# Altium schematic sheet Power_48_20V@3A.SchDoc
size A3
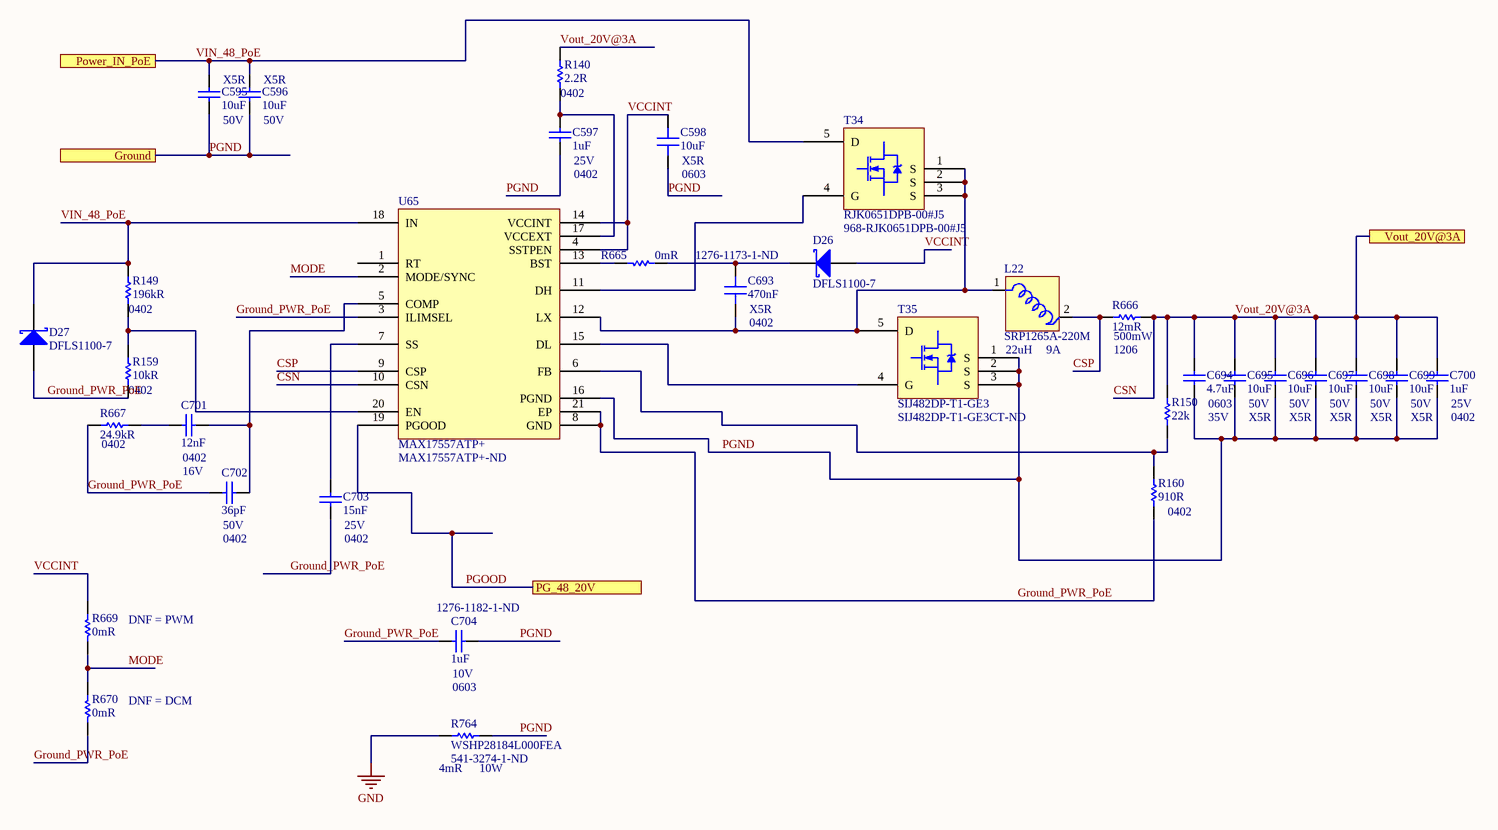
[diagram p0: Power_48_20V@3A.SchDoc]

## Parts
C595  10uF  Voltage Rating (DC): 50V  Dielectric: X5R  [CAP 0805/2012 RF]
C596  10uF  Voltage Rating (DC): 50V  Dielectric: X5R  [CAP 0805/2012 RF]
C597  1uF  Case/Package: 0402  Voltage Rating: 25V  [CAP 0402/1005 KK]
C598  10uF  Case/Package: 0603  Dielectric: X5R  [CAP 0603/1608 RF]
C693  470nF  Supplier Part Number 1: 1276-1173-1-ND  Case/Package: 0402  Dielectric: X5R  [CAP 0402/1005 KK]
C694  4.7uF  Case/Package: 0603  Voltage Rating: 35V  [CAP 0603/1608 RF]
C695  10uF  Voltage Rating (DC): 50V  Dielectric: X5R  [CAP 0805/2012 RF]
C696  10uF  Voltage Rating (DC): 50V  Dielectric: X5R  [CAP 0805/2012 RF]
C697  10uF  Voltage Rating (DC): 50V  Dielectric: X5R  [CAP 0805/2012 RF]
C698  10uF  Voltage Rating (DC): 50V  Dielectric: X5R  [CAP 0805/2012 RF]
C699  10uF  Voltage Rating (DC): 50V  Dielectric: X5R  [CAP 0805/2012 RF]
C700  1uF  Case/Package: 0402  Voltage Rating: 25V  [CAP 0402/1005 KK]
C701  12nF  Case/Package: 0402  Voltage Rating: 16V  [CAP 0402/1005 KK]
C702  36pF  Case Code (Imperial): 0402  Voltage Rating (DC): 50V  [CAP 0402/1005 KK]
C703  15nF  Case/Package: 0402  Voltage Rating: 25V  [CAP 0402/1005 KK]
C704  1uF  Supplier Part Number 1: 1276-1182-1-ND  Case/Package: 0603  Voltage Rating: 10V  [CAP 0603/1608 RF]
D26  DFLS1100-7  [DFLS1100]
D27  DFLS1100-7  [DFLS1100]
L22  SRP1265A-220M  Max DC Current: 9A  Inductance: 22uH  [SRP1265A-220M]
R140  2.2R  Case Code (Imperial): 0402  [RES 0402/1005 RF KK]
R149  196kR  Case/Package: 0402  [RES 0402/1005 RF KK]
R150  22k  [RES 0402/1005 RF KK]
R159  10kR  Case Code (Imperial): 0402  [RES 0402/1005 RF KK]
R160  910R  Case/Package: 0402  [RES 0402/1005 RF KK]
R665  0mR  [RES 0402/1005 RF KK]
R666  12mR  Case/Package: 1206  Max Power Dissipation: 500mW  [RES 1206/3216]
R667  24.9kR  Case/Package: 0402  [RES 0402/1005 RF KK]
R669  0mR  [RES 0402/1005 RF KK]
R670  0mR  [RES 0402/1005 RF KK]
R764  WSHP28184L000FEA  Resistance: 4mR  Max Power Dissipation: 10W  Supplier Part Number 1: 541-3274-1-ND  [WSHP2818]
T34  RJK0651DPB-00#J5  Supplier Part Number 1: 968-RJK0651DPB-00#J5  [RJK0651DPB]
T35  SIJ482DP-T1-GE3  Supplier Part Number 1: SIJ482DP-T1-GE3CT-ND  [SiJ482DP]
U65  MAX17557ATP+  Supplier Part Number 1: MAX17557ATP+-ND  [MAX17557]

## Ports
Ground, PG_48_20V, Power_IN_PoE, Vout_20V@3A

## Nets
GND: R764.1
CSN: C694.2 C695.2 C696.2 C697.2 C698.2 C699.2 C700.2 R140.2 R150.2 R666.2 U65.10(CSN) ; port Vout_20V@3A  [also labelled Vout_20V@3A]
CSP: L22.2 R666.1 U65.9(CSP)
Ground_PWR_PoE: C702.1 C703.1 C704.1 D27.2(A) R159.1 R160.1 R667.1 R670.2 U65.3(ILIMSEL) U65.8(GND) U65.21(EP)
MODE: R669.2 R670.1 U65.2(MODE/SYNC)
PGND: C595.1 C596.1 C597.1 C598.1 C694.1 C695.1 C696.1 C697.1 C698.1 C699.1 C700.1 C704.2 R764.2 T35.1(S) T35.2(S) T35.3(S) U65.16(PGND) ; port Ground
PGOOD: U65.19(PGOOD) ; port PG_48_20V
VCCINT: C598.2 D26.2(A) R669.1 U65.4(SSTPEN) U65.14(VCCINT)
VIN_48_PoE: C595.2 C596.2 D27.1(K) R149.2 T34.5(D) U65.18(IN) ; port Power_IN_PoE
NetC597_2: C597.2 R140.1 U65.17(VCCEXT)
NetC693_1: C693.1 L22.1 T34.1(S) T34.2(S) T34.3(S) T35.5(D) U65.12(LX)
NetC693_2: C693.2 D26.1(K) R665.1
NetC701_1: C701.1 R667.2
NetC701_2: C701.2 C702.2 U65.5(COMP)
NetC703_2: C703.2 U65.7(SS)
NetR149_1: R149.1 R159.2 U65.20(EN)
NetR150_1: R150.1 R160.2 U65.6(FB)
NetR665_2: R665.2 U65.13(BST)
NetT34_4: T34.4(G) U65.11(DH)
NetT35_4: T35.4(G) U65.15(DL)

Not connected (* = marked no-connect by the designer): U65 1(RT)

## Notes on the sheet
- (near R669) DNF = PWM
- (near R670) DNF = DCM
- Title
- Size:
- Date:
- A3
- Number:
- Time:
- Revision:
- Sheet
- of
- File:

## Library data of the parts
C595 C596 C695-C699 = Capacitor: Manufacturer: Murata; Manufacturer Part Number: GRM21BR61H106KE43L; Tolerance: 10%; Supplier 1: Digi-Key; Supplier Part Number 1: 490-18663-1-ND; RoHS: No; Category: Ceramic Capacitors; Stock 1: 3437; Pricing 1: 1=0,49000, 10=0,33800, 100=0,20270, 500=0,15198, 1000=0,12835 (USD); Capacitance: 10uF; Length: 2mm; Width: 1.25mm; Thickness: 1.25mm
C597 C700 = Capacitor: MURATA - GRT155R61E105KE01D - SMD Multilayer Ceramic Capacitor, 1 µF, 25 V, 0402 [1005 Metric], ± 10%, X5R, GRT Series - SMD Multilayer Ceramic Capacitor, 1 µF, 25 V, 0402 [1005 Metric], ± 10%, X5R, GRT Series; Supplier 1: Digi-Key; Supplier Part Number 1: 490-12263-1-ND; Manufacturer: Murata; Manufacturer Part Number: GRT155R61E105KE01D; RoHS: Yes; Category: Ceramic Capacitors; Stock 1: 341453; Pricing 1: 1=0,18000, 10=0,12300, 100=0,06210, 500=0,04248, 1000=0,03758, 2500=0,03594, 5000=0,03268 (USD); Mount: Surface Mount; Case Code (Metric): 1005; Case Code (Imperial): 0402; Min Operating Temperature: -55°C; Max Operating Temperature: 85°C; Packaging: Tape and Reel; Capacitance: 1uF; Tolerance: 10%; Dielectric: X5R; Voltage Rating (DC): 25V; Length: 0.039inch; Width: 0.02inch; Thickness: 0.022inch; Ratings: AEC-Q200; ComponentLink1URL: http://www.farnell.com/datasheets/2165918.pdf?src-supplier=Farnell; ComponentLink1Description: http://www.farnell.com/datasheets/2165918.pdf?src-supplier=Farnell; ComponentLink2URL: http://search.murata.co.jp/Ceramy/image/img/A01X/G101/ENG/GRT155R61E105KE01-01.pdf?src-supplier=Digi-Key; ComponentLink2Description: http://search.murata.co.jp/Ceramy/image/img/A01X/G101/ENG/GRT155R61E105KE01-01.pdf?src-supplier=Digi-Key; ComponentLink3URL: http://www.farnell.com/datasheets/2165918.pdf?src-supplier=Element14; ComponentLink3Description: http://www.farnell.com/datasheets/2165918.pdf?src-supplier=Element14
C598 = Capacitor: Manufacturer: Murata; Manufacturer Part Number: GRM188R61A106KE69D; Tolerance: 10%; Voltage Rating: 10V; Supplier 1: Digi-Key; Supplier Part Number 1: 490-10474-1-ND; Stock 1: 4597169; Pricing 1: 1 = 0,21000, 10 = 0,14000, 100 = 0,07110, 500 = 0,04864, 1000 = 0,04303 (USD); RoHS: Yes; Mount: Surface Mount; Case Code (Metric): 1608; Case Code (Imperial): 0603; Min Operating Temperature: -55°C; Max Operating Temperature: 85°C; Capacitance: 10uF; Packaging: Tape and Reel; Voltage: 10V; Voltage Rating (DC): 10V; Length: 1.6mm; Height: 0.8mm; Width: 0.031inch; Thickness: 0.037inch; Depth: 0.8mm; REACH SVHC: No SVHC; Lead Free: Lead Free; ComponentLink1URL: http://components.arrow.com/part/dataview/0323_07281717?src-supplier=Arrow+Europe; ComponentLink1Description: http://components.arrow.com/part/dataview/0323_07281717?src-supplier=Arrow+Europe; ComponentLink2URL: http://www.farnell.com/datasheets/1955682.pdf?src-supplier=Farnell; ComponentLink2Description: http://www.farnell.com/datasheets/1955682.pdf?src-supplier=Farnell; ComponentLink3URL: http://www.mouser.com/ds/2/281/c02e-2905.pdf?src-supplier=Mouser; ComponentLink3Description: http://www.mouser.com/ds/2/281/c02e-2905.pdf?src-supplier=Mouser; ComponentLink4URL: http://search.murata.co.jp/Ceramy/image/img/A01X/G101/ENG/GRM188R61A106KE69-01.pdf?src-supplier=Digi-Key; ComponentLink4Description: http://search.murata.co.jp/Ceramy/image/img/A01X/G101/ENG/GRM188R61A106KE69-01.pdf?src-supplier=Digi-Key; ComponentLink5URL: http://www.farnell.com/datasheets/1955682.pdf?src-supplier=Element14; ComponentLink5Description: http://www.farnell.com/datasheets/1955682.pdf?src-supplier=Element14; ComponentLink6URL: http://www.farnell.com/datasheets/1955682.pdf?src-supplier=Newark; ComponentLink6Description: http://www.farnell.com/datasheets/1955682.pdf?src-supplier=Newark; ComponentLink7URL: http://psearch.en.murata.com/capacitor/product/GRM188R61A106KE69%23.pdf?src-supplier=Avnet; ComponentLink7Description: http://psearch.en.murata.com/capacitor/product/GRM188R61A106KE69%23.pdf?src-supplier=Avnet
C693 = Capacitor: Manufacturer: Samsung; Manufacturer Part Number: CL05A474KP5NNNC; Tolerance: 10%; Voltage Rating: 10V; Supplier 1: Digi-Key; Stock 1: 941442; Pricing 1: 1 = 0,10000, 10 = 0,07000, 100 = 0,03140, 500 = 0,02240, 1000 = 0,01761, 2500 = 0,01600, 5000 = 0,01472 (USD); RoHS: Yes; Mount: Surface Mount; Case Code (Metric): 1005; Case Code (Imperial): 0402; Min Operating Temperature: -55°C; Max Operating Temperature: 85°C; Capacitance: 470nF; Packaging: Tape and Reel; Voltage Rating (DC): 10V; Length: 1mm; Height: 0.5mm; Width: 0.02inch; Thickness: 0.022inch; Depth: 0.5mm; Radiation Hardening: No; Lead Free: Lead Free; ComponentLink1URL: https://datasheet.ciiva.com/25710/cl05a474kp5nnnc-25710324.pdf?src-supplier=Digi-Key; ComponentLink1Description: https://datasheet.ciiva.com/25710/cl05a474kp5nnnc-25710324.pdf?src-supplier=Digi-Key; ComponentLink2URL: https://datasheet.ciiva.com/26838/getdatasheetpartid-355286-26838191.pdf?src-supplier=Verical; ComponentLink2Description: https://datasheet.ciiva.com/26838/getdatasheetpartid-355286-26838191.pdf?src-supplier=Verical; ComponentLink3URL: https://datasheet.ciiva.com/16437/cl05b104kq5nnnc-16437351.pdf?src-supplier=Future+Electronics; ComponentLink3Description: https://datasheet.ciiva.com/16437/cl05b104kq5nnnc-16437351.pdf?src-supplier=Future+Electronics
C694 = Capacitor: 0603 4.7 uF 35 V ±10% Tolerance X5R Multilayer Ceramic Chip Capacitor; Manufacturer: Murata; Manufacturer Part Number: GRM188R6YA475KE15D; Supplier 1: Digi-Key; Supplier Part Number 1: 490-7205-6-ND; RoHS: Yes; Category: Ceramic Capacitors; Stock 1: 211150; Pricing 1: 1=0,50000, 10=0,34900, 100=0,20950, 500=0,15712, 1000=0,13267 (USD); Mount: Surface Mount; Weight: 0.000222oz; Case Code (Metric): 1608; Case Code (Imperial): 0603; Material: Ceramic; Min Operating Temperature: -55°C; Max Operating Temperature: 85°C; Capacitance: 4.7uF; Tolerance: 10%; Packaging: Tape and Reel; Package Quantity: 4000; Dielectric: X5R; Voltage: 35V; Termination: SMD/SMT; Composition: Ceramic; Voltage Rating (DC): 35V; Length: 1.6mm; Height: 0.8mm; Width: 0.8mm; Thickness: 0.031inch; Depth: 0.8mm; REACH SVHC: No SVHC; Lead Free: Lead Free; ComponentLink1URL: https://datasheet.ciiva.com/46444/1769893-46444984.pdf?src-supplier=Element14; ComponentLink1Description: https://datasheet.ciiva.com/46444/1769893-46444984.pdf?src-supplier=Element14; ComponentLink2URL: https://datasheet.ciiva.com/46444/1769893-46444985.pdf?src-supplier=Element14; ComponentLink2Description: https://datasheet.ciiva.com/46444/1769893-46444985.pdf?src-supplier=Element14; ComponentLink3URL: https://datasheet.ciiva.com/14906/partnumbering-e-01-14906426.pdf?src-supplier=Digi-Key; ComponentLink3Description: https://datasheet.ciiva.com/14906/partnumbering-e-01-14906426.pdf?src-supplier=Digi-Key; ComponentLink4URL: https://datasheet.ciiva.com/14906/partnumbering-e-01-14906427.pdf?src-supplier=Digi-Key; ComponentLink4Description: https://datasheet.ciiva.com/14906/partnumbering-e-01-14906427.pdf?src-supplier=Digi-Key; ComponentLink5URL: https://datasheet.ciiva.com/14906/partnumbering-e-01-14906428.pdf?src-supplier=Digi-Key; ComponentLink5Description: https://datasheet.ciiva.com/14906/partnumbering-e-01-14906428.pdf?src-supplier=Digi-Key
C701 = Capacitor: CAP, MLCC, X7R, 0.012UF, 16V, 0402; Product Range:C Series; Capacitance:0.012 F; Capacitance Tolerance: 10%; Dielectric Characteristic:X7R; Voltage Rating:16V; Ceramic Capacitor Case:0402 [1005 Metric]; Operating Temperature ;RoHS Compliant: Yes; Manufacturer: KEMET; Manufacturer Part Number: C0402C123K4RACTU; Dissipation Factor: 3.5%; Supplier 1: Digi-Key; Supplier Part Number 1: 399-4875-1-ND; RoHS: Yes; Category: Ceramic Capacitors; Stock 1: 50010; Pricing 1: 1=0,10000, 10=0,07000, 100=0,03100, 500=0,02214, 1000=0,01739, 2500=0,01581, 5000=0,01455 (USD); Mount: Surface Mount,PCB; Case Code (Imperial): 0402; Case Code (Metric): 1005; Dielectric Material: Ceramic; Min Operating Temperature: -55°C; Max Operating Temperature: 125°C; Tolerance: 10%; Packaging: Tape and Reel; Capacitance: 12nF; Package Quantity: 1; Voltage Rating (DC): 16V; Dielectric: X7R; Termination: SMD/SMT; Voltage: 16V; Length: 1mm; Height: 0.5mm; Width: 0.5mm; Lead Pitch: 0.3mm; Thickness: 0.022inch; Depth: 0.5mm; REACH SVHC: No SVHC; ComponentLink1URL: https://datasheet.ciiva.com/14599/70095383-14599514.pdf?src-supplier=Allied+Electronics; ComponentLink1Description: https://datasheet.ciiva.com/14599/70095383-14599514.pdf?src-supplier=Allied+Electronics; ComponentLink2URL: https://datasheet.ciiva.com/14606/70095383-14606845.pdf?src-supplier=Allied+Electronics; ComponentLink2Description: https://datasheet.ciiva.com/14606/70095383-14606845.pdf?src-supplier=Allied+Electronics
C702 = Capacitor: Ceramic Capacitor 36PF 50V, C0G, 5%, 0402, Full Reel; Manufacturer: Kyocera AVX; Manufacturer Part Number: 04025A360JAT2A; Supplier 1: Digi-Key; Supplier Part Number 1: 478-10099-1-ND; RoHS: Yes; Category: Ceramic Capacitors; Stock 1: 21315; Pricing 1: 1=0,13000, 10=0,09000, 100=0,04240, 500=0,02972, 1000=0,02461, 2500=0,02290, 5000=0,02095 (USD); Mount: Surface Mount; Case/Package: 0402; Number of Pins: 2; Case Code (Metric): 1005; Min Operating Temperature: -55°C; Max Operating Temperature: 125°C; Capacitance: 36pF; Tolerance: 5%; Packaging: Tape and Reel; Package Quantity: 10000; Voltage Rating: 50V; Dielectric: C0G; Termination: SMD/SMT; Length: 1mm; Width: 0.02inch; Thickness: 0.022inch; Depth: 0.5mm; Radiation Hardening: No; ComponentLink1URL: https://datasheet.ciiva.com/205/ccog-205476.pdf?src-supplier=Digi-Key; ComponentLink1Description: https://datasheet.ciiva.com/205/ccog-205476.pdf?src-supplier=Digi-Key; ComponentLink2URL: https://datasheet.ciiva.com/5423/ccog-5423162.pdf?src-supplier=Mouser; ComponentLink2Description: https://datasheet.ciiva.com/5423/ccog-5423162.pdf?src-supplier=Mouser
C703 = Capacitor: Cap Ceramic 0.015uF 25V X7R 10% SMD 0402 125C Paper T/R; Manufacturer: Yageo; Manufacturer Part Number: CC0402KRX7R8BB153; Supplier 1: Digi-Key; Supplier Part Number 1: 311-1713-1-ND; RoHS: Yes; Category: Ceramic Capacitors; Stock 1: 34974; Pricing 1: 1=0,10000, 10=0,04300, 100=0,01920, 500=0,01374, 1000=0,01080, 2500=0,00982, 5000=0,00903 (USD); Mount: Surface Mount; Weight: 2.3E-05oz; Case Code (Imperial): 0402; Case Code (Metric): 1005; Min Operating Temperature: -55°C; Max Operating Temperature: 125°C; Tolerance: 10%; Packaging: Tape and Reel; Capacitance: 15nF; Voltage Rating (DC): 25V; Dielectric: X7R; Termination: SMD/SMT; Composition: Ceramic; Length: 1mm; Height: 0.5mm; Width: 0.02inch; Thickness: 0.022inch; Depth: 0.5mm; Radiation Hardening: No; Lead Free: Lead Free; Halogen Free: Halogen Free; ComponentLink1URL: https://datasheet.ciiva.com/13208/upy-gphc-x7r-6-3v-to-50v-8-12304-13208892.pdf?src-supplier=Mouser; ComponentLink1Description: https://datasheet.ciiva.com/13208/upy-gphc-x7r-6-3v-to-50v-8-12304-13208892.pdf?src-supplier=Mouser; ComponentLink2URL: https://datasheet.ciiva.com/17437/upy-gphc-x7r-6-3v-to-50v-8-17437359.pdf?src-supplier=Avnet+Europe; ComponentLink2Description: https://datasheet.ciiva.com/17437/upy-gphc-x7r-6-3v-to-50v-8-17437359.pdf?src-supplier=Avnet+Europe; ComponentLink3URL: https://datasheet.ciiva.com/11464/upy-gphc-x7r-6-3v-to-50v-8-11464890.pdf?src-supplier=Avnet; ComponentLink3Description: https://datasheet.ciiva.com/11464/upy-gphc-x7r-6-3v-to-50v-8-11464890.pdf?src-supplier=Avnet; ComponentLink4URL: https://datasheet.ciiva.com/26829/getdatasheetpartid-748495-26829322.pdf?src-supplier=Verical; ComponentLink4Description: https://datasheet.ciiva.com/26829/getdatasheetpartid-748495-26829322.pdf?src-supplier=Verical
C704 = Capacitor: Cap Ceramic 1uF 10V X5R 10% SMD 0603 85C Paper T/R; Manufacturer: Samsung; Manufacturer Part Number: CL10A105KP8NNNC; Supplier 1: Digi-Key; RoHS: Yes; Category: Ceramic Capacitors; Stock 1: 3646234; Pricing 1: 1=0,10000, 10=0,03600, 100=0,01610, 500=0,01152, 1000=0,00905 (USD); Mount: Surface Mount; Case Code (Metric): 1608; Case Code (Imperial): 0603; Contact Plating: Tin; Min Operating Temperature: -55°C; Max Operating Temperature: 85°C; Tolerance: 10%; Packaging: Tape and Reel; Package Quantity: 1; Capacitance: 1uF; Dielectric: X5R; Voltage: 10V; Length: 1.6mm; Height: 0.8mm; Width: 0.031inch; Thickness: 0.035inch; Depth: 0.8mm; Radiation Hardening: No; ComponentLink1URL: https://datasheet.ciiva.com/15195/getdatasheetpartid-358616-15195708.pdf?src-supplier=Verical; ComponentLink1Description: https://datasheet.ciiva.com/15195/getdatasheetpartid-358616-15195708.pdf?src-supplier=Verical; ComponentLink2URL: https://datasheet.ciiva.com/16358/cl05b104kq5nnnc-16358431.pdf?src-supplier=Future+Electronics; ComponentLink2Description: https://datasheet.ciiva.com/16358/cl05b104kq5nnnc-16358431.pdf?src-supplier=Future+Electronics
D26 D27 = DFLS1100-7: DIODE SCHOTTKY 100V POWERDI123; Manufacturer: Diodes; Forward Voltage: 770mV; Forward Current: 1A; Peak Reverse Current: 1uA; Peak Non-Repetitive Surge Current: 50A; Max Forward Surge Current (Ifsm): 40A; Element Configuration: Single; Polarity: Standard; Capacitance: 36pF; Supplier 1: Digi-Key; Manufacturer Part Number: DFLS1100-7; RoHS: Yes; Category: Rectifier Diodes; Stock 1: 113187; Pricing 1: 1=0,41000, 10=0,35100, 25=0,32760, 100=0,24340, 250=0,23120, 500=0,19000, 1000=0,15444 (USD); Mount: Surface Mount; Number of Pins: 2; Min Operating Temperature: -55°C; Max Operating Temperature: 175°C; Packaging: Tape and Reel; Package Quantity: 3000; Average Rectified Current: 1A; Max Repetitive Reverse Voltage (Vrrm): 100V; Termination: SMD/SMT; Voltage Rating (DC): 100V; Current Rating: 1A; Output Current: 1A; Max Reverse Voltage (DC): 100V; Length: 2.8mm; Height: 0.98mm; Width: 1.78mm; Radiation Hardening: No; REACH SVHC: No SVHC; Lead Free: Lead Free; ComponentLink1URL: https://datasheet.ciiva.com/6932/ds30497-6932064.pdf?src-supplier=Newark; ComponentLink1Description: https://datasheet.ciiva.com/6932/ds30497-6932064.pdf?src-supplier=Newark; ComponentLink2URL: https://datasheet.ciiva.com/4715/ds30497-81105-4715653.pdf?src-supplier=Mouser; ComponentLink2Description: https://datasheet.ciiva.com/4715/ds30497-81105-4715653.pdf?src-supplier=Mouser; ComponentLink3URL: https://datasheet.ciiva.com/4245/2460ds30497-4245287.pdf?src-supplier=Arrow; ComponentLink3Description: https://datasheet.ciiva.com/4245/2460ds30497-4245287.pdf?src-supplier=Arrow; ComponentLink4URL: https://datasheet.ciiva.com/15144/getdatasheetpartid-44146-15144126.pdf?src-supplier=Verical; ComponentLink4Description: https://datasheet.ciiva.com/15144/getdatasheetpartid-44146-15144126.pdf?src-supplier=Verical; ComponentLink5URL: https://datasheet.ciiva.com/26788/dfls1100-7-26788776.pdf?src-supplier=IIIC; ComponentLink5Description: https://datasheet.ciiva.com/26788/dfls1100-7-26788776.pdf?src-supplier=IIIC; ComponentLink6URL: https://datasheet.ciiva.com/914/ds30497-914548.pdf?src-supplier=Digi-Key; ComponentLink6Description: https://datasheet.ciiva.com/914/ds30497-914548.pdf?src-supplier=Digi-Key; ComponentLink7URL: https://datasheet.ciiva.com/914/ds30497-914549.pdf?src-supplier=Digi-Key; ComponentLink7Description: https://datasheet.ciiva.com/914/ds30497-914549.pdf?src-supplier=Digi-Key; ComponentLink8URL: https://datasheet.ciiva.com/914/ds30497-914550.pdf?src-supplier=Digi-Key; ComponentLink8Description: https://datasheet.ciiva.com/914/ds30497-914550.pdf?src-supplier=Digi-Key; ComponentLink9URL: https://datasheet.ciiva.com/7964/ds30497-7964246.pdf?src-supplier=Element14; ComponentLink9Description: https://datasheet.ciiva.com/7964/ds30497-7964246.pdf?src-supplier=Element14; ComponentLink10URL: https://datasheet.ciiva.com/22695/1915475-22695803.pdf?src-supplier=Element14; ComponentLink10Description: https://datasheet.ciiva.com/22695/1915475-22695803.pdf?src-supplier=Element14; Supplier Part Number 1: DFLS1100DICT-ND
L22 = SRP1265A-220M: Inductor Power Shielded Wirewound 22uH 20% 100KHz 20Q-Factor Carbonyl Powder 9A 37mOhm DCR Automotive T/R; Manufacturer: Bourns; Saturation Current: 12A; DC Resistance (DCR): 37mR; Self Resonant Frequency: 6MHz; Supplier 1: Digi-Key; Manufacturer Part Number: SRP1265A-220M; Stock 1: 17828; Pricing 1: 1 = 2,06000, 10 = 1,89800, 100 = 1,32830 (USD); RoHS: Yes; Mount: Surface Mount; Case/Package: Nonstandard; Core Material: Carbonyl Powder; Min Operating Temperature: -40°C; Max Operating Temperature: 150°C; Packaging: Cut Tape; Tolerance: 20%; Composition: Wirewound; Current Rating: 9A; Shielding: Shielded; Test Frequency: 100kHz; RMS Current (Irms): 9A; DC Current: 9A; Military Standard: Not; Termination: SMD/SMT; Inductance Tolerance: 20%; Length: 0.531inch; Height: 6.2mm; Width: 0.492inch; Height - Seated (Max): 0.252inch; Depth: 12.8mm; Ratings: AEC-Q200; REACH SVHC: No SVHC; ComponentLink1URL: https://datasheet.ciiva.com/48685/srp1265a-48685099.pdf?src-supplier=Avnet; ComponentLink1Description: https://datasheet.ciiva.com/48685/srp1265a-48685099.pdf?src-supplier=Avnet; ComponentLink2URL: https://datasheet.ciiva.com/48685/srp1265a-48685101.pdf?src-supplier=Avnet; ComponentLink2Description: https://datasheet.ciiva.com/48685/srp1265a-48685101.pdf?src-supplier=Avnet; Supplier Part Number 1: SRP1265A-220MCT-ND
R140 = Resistor: RES SMD 2.2 OHM 5% 1/16W 0402; Manufacturer: Yageo; Manufacturer Part Number: RC0402JR-072R2L; Power Rating: 62.5mW; Voltage Rating: 50V; Temperature Coefficient: 200ppm/°C; Max Power Dissipation: 63mW; Supplier 1: Digi-Key; Supplier Part Number 1: 311-2.2JRCT-ND; RoHS: Yes; Category: Chip SMD Resistors; Stock 1: 928927; Pricing 1: 1=0,10000, 10=0,01900, 100=0,00760, 1000=0,00342, 2500=0,00297, 5000=0,00245 (USD); Case/Package: 0402; Number of Pins: 2; Case Code (Metric): 1005; Contact Plating: Tin,Matte,Lead; Min Operating Temperature: -55°C; Max Operating Temperature: 155°C; Resistance: 2.2R; Tolerance: 5%; Packaging: Tape and Reel; Package Quantity: 1; Composition: Thick Film; Number of Terminations: 2; Termination: SMD/SMT; Military Standard: Not; Features: Moisture Resistant; Voltage Rating (DC): 50V; Working Voltage: 50V; Length: 1mm; Height: 0.016inch; Width: 0.02inch; Depth: 0.5mm; Radiation Hardening: No; REACH SVHC: No SVHC; Lead Free: Lead Free; ComponentLink1URL: https://datasheet.ciiva.com/2452/pyu-r-int-thick-7-2452737.pdf?src-supplier=Digi-Key; ComponentLink1Description: https://datasheet.ciiva.com/2452/pyu-r-int-thick-7-2452737.pdf?src-supplier=Digi-Key; ComponentLink2URL: https://datasheet.ciiva.com/2452/pyu-r-int-thick-7-2452738.pdf?src-supplier=Digi-Key; ComponentLink2Description: https://datasheet.ciiva.com/2452/pyu-r-int-thick-7-2452738.pdf?src-supplier=Digi-Key; ComponentLink3URL: https://datasheet.ciiva.com/2452/pyu-r-int-thick-7-2452739.pdf?src-supplier=Digi-Key; ComponentLink3Description: https://datasheet.ciiva.com/2452/pyu-r-int-thick-7-2452739.pdf?src-supplier=Digi-Key; ComponentLink4URL: https://datasheet.ciiva.com/28639/1018594-28639893.pdf?src-supplier=Element14; ComponentLink4Description: https://datasheet.ciiva.com/28639/1018594-28639893.pdf?src-supplier=Element14; ComponentLink5URL: https://datasheet.ciiva.com/28415/pyu-rc0402-51-rohs-l-6-28415222.pdf?src-supplier=Avnet+Europe; ComponentLink5Description: https://datasheet.ciiva.com/28415/pyu-rc0402-51-rohs-l-6-28415222.pdf?src-supplier=Avnet+Europe; ComponentLink6URL: https://datasheet.ciiva.com/16863/pyu-rc0402-51-rohs-l-6-16863111.pdf?src-supplier=Avnet+Europe; ComponentLink6Description: https://datasheet.ciiva.com/16863/pyu-rc0402-51-rohs-l-6-16863111.pdf?src-supplier=Avnet+Europe; ComponentLink7URL: https://datasheet.ciiva.com/8894/pyu-rc0402-51-rohs-l-6-8894569.pdf?src-supplier=Avnet; ComponentLink7Description: https://datasheet.ciiva.com/8894/pyu-rc0402-51-rohs-l-6-8894569.pdf?src-supplier=Avnet; ComponentLink8URL: https://datasheet.ciiva.com/15189/getdatasheetpartid-470524-15189562.pdf?src-supplier=Verical; ComponentLink8Description: https://datasheet.ciiva.com/15189/getdatasheetpartid-470524-15189562.pdf?src-supplier=Verical; ComponentLink9URL: https://datasheet.ciiva.com/12557/pyu-rc0402-51-rohs-l-6-r-8721-12557918.pdf?src-supplier=Mouser; ComponentLink9Description: https://datasheet.ciiva.com/12557/pyu-rc0402-51-rohs-l-6-r-8721-12557918.pdf?src-supplier=Mouser
R149 = Resistor: Thick Film Resistors - SMD 196K OHM 1%; Manufacturer: Yageo; Manufacturer Part Number: RC0402FR-07196KL; Power Rating: 62.5mW; Voltage Rating: 50V; Temperature Coefficient: 100ppm/°C; Max Power Dissipation: 63mW; Supplier 1: Digi-Key; Supplier Part Number 1: YAG3024CT-ND; RoHS: Yes; Category: Chip SMD Resistors; Stock 1: 126965; Pricing 1: 1=0,10000, 10=0,01600, 100=0,00640, 1000=0,00289, 2500=0,00251, 5000=0,00207 (USD); Case Code (Imperial): 0402; Case Code (Metric): 1005; Contact Plating: Tin,Lead; Min Operating Temperature: -55°C; Max Operating Temperature: 155°C; Packaging: Tape and Reel; Resistance: 196kR; Tolerance: 1%; Composition: Thick Film; Termination: SMD/SMT; Number of Terminations: 2; Military Standard: Not; Features: Moisture Resistant; Length: 1mm; Height: 0.016inch; Width: 0.5mm; Depth: 0.5mm; Radiation Hardening: No; Lead Free: Lead Free; ComponentLink1URL: https://datasheet.ciiva.com/28419/pyu-rc0402-51-rohs-l-6-28419942.pdf?src-supplier=Avnet+Europe; ComponentLink1Description: https://datasheet.ciiva.com/28419/pyu-rc0402-51-rohs-l-6-28419942.pdf?src-supplier=Avnet+Europe; ComponentLink2URL: https://datasheet.ciiva.com/16869/pyu-rc0402-51-rohs-l-6-16869399.pdf?src-supplier=Avnet+Europe; ComponentLink2Description: https://datasheet.ciiva.com/16869/pyu-rc0402-51-rohs-l-6-16869399.pdf?src-supplier=Avnet+Europe
R150 = Resistor: TE CONNECTIVITY - CRGCQ0402F22K - RES, 22K, 1%, 0402, THICK FILM; Supplier 1: Digi-Key; Supplier Part Number 1: A129643CT-ND; Manufacturer: TE Connectivity; Manufacturer Part Number: CRGCQ0402F22K; RoHS: No; Stock 1: 153295; Pricing 1: 1=0,10000, 10=0,02100, 100=0,00860, 1000=0,00387, 2500=0,00336, 5000=0,00277 (USD); ComponentLink1URL: http://www.farnell.com/datasheets/2609223.pdf?src-supplier=Farnell; ComponentLink1Description: http://www.farnell.com/datasheets/2609223.pdf?src-supplier=Farnell
R159 = Resistor: Surface Mount Thick Film Resistor, Rc Series, 10 Kohm, 62.5 Mw, - 1%, 50 V, 0402 [1005 Metric]; Manufacturer: Yageo; Manufacturer Part Number: RC0402FR-0710KL; Voltage Rating: 50V; Power Rating: 62.5mW; Temperature Coefficient: 100ppm/°C; Supplier 1: Digi-Key; Supplier Part Number 1: 311-10.0KLRDKR-ND; RoHS: Yes; Category: Chip SMD Resistors; Stock 1: 50506721; Pricing 1: 1=0,10000, 10=0,01600, 100=0,00640, 1000=0,00289, 2500=0,00251, 5000=0,00207 (USD); Case/Package: 0402; Number of Pins: 2; Case Code (Metric): 1005; Min Operating Temperature: -55°C; Max Operating Temperature: 155°C; Resistance: 10kR; Tolerance: 1%; Packaging: Tape and Reel; Termination: SMD/SMT; Composition: Thick Film; Military Standard: Not; Voltage Rating (DC): 50V; Working Voltage: 50V; Number of Terminations: 2; Length: 1mm; Height: 0.32mm; Width: 0.5mm; Depth: 0.5mm; Lead Pitch: 0.2mm; REACH SVHC: No SVHC; Lead Free: Lead Free; ComponentLink1URL: https://datasheet.ciiva.com/7660/38568-7660787.pdf?src-supplier=Element14; ComponentLink1Description: https://datasheet.ciiva.com/7660/38568-7660787.pdf?src-supplier=Element14; ComponentLink2URL: https://datasheet.ciiva.com/7849/1784430-7849813.pdf?src-supplier=Element14; ComponentLink2Description: https://datasheet.ciiva.com/7849/1784430-7849813.pdf?src-supplier=Element14; ComponentLink3URL: https://datasheet.ciiva.com/7849/1686128-7849814.pdf?src-supplier=Element14; ComponentLink3Description: https://datasheet.ciiva.com/7849/1686128-7849814.pdf?src-supplier=Element14; ComponentLink4URL: https://datasheet.ciiva.com/7849/1784430-7849815.pdf?src-supplier=Element14; ComponentLink4Description: https://datasheet.ciiva.com/7849/1784430-7849815.pdf?src-supplier=Element14; ComponentLink5URL: https://datasheet.ciiva.com/22747/1018594-22747512.pdf?src-supplier=Element14; ComponentLink5Description: https://datasheet.ciiva.com/22747/1018594-22747512.pdf?src-supplier=Element14; ComponentLink6URL: https://datasheet.ciiva.com/12667/pyu-rc0402-51-rohs-l-6-r-12667067.pdf?src-supplier=Mouser; ComponentLink6Description: https://datasheet.ciiva.com/12667/pyu-rc0402-51-rohs-l-6-r-12667067.pdf?src-supplier=Mouser; ComponentLink7URL: https://datasheet.ciiva.com/7983/1018594-7983486.pdf?src-supplier=Element14; ComponentLink7Description: https://datasheet.ciiva.com/7983/1018594-7983486.pdf?src-supplier=Element14
R160 = Resistor: RES SMD 910 OHM 5% 1/10W 0402; Manufacturer: Panasonic; Manufacturer Part Number: ERJ2GEJ911X; Power Rating: 100mW; Voltage Rating: 50V; Temperature Coefficient: 200ppm/°C; Supplier 1: Digi-Key; Supplier Part Number 1: P910JCT-ND; RoHS: Yes; Category: Chip SMD Resistors; Stock 1: 129458; Pricing 1: 1=0,10000, 10=0,02700, 100=0,01100, 1000=0,00496, 2500=0,00430, 5000=0,00355 (USD); Mount: Surface Mount; Case Code (Metric): 1005; Case Code (Imperial): 0402; Contact Plating: Tin; Min Operating Temperature: -55°C; Max Operating Temperature: 155°C; Packaging: Tape and Reel; Package Quantity: 1; Resistance: 910R; Tolerance: 5%; Composition: Thick Film; Termination: SMD/SMT; Voltage Rating (DC): 50V; Number of Terminations: 2; Military Standard: Not; Max Power Dissipation: 100mW; Length: 1mm; Height: 0.35mm; Width: 0.02inch; Depth: 0.5mm; Radiation Hardening: No; Lead Free: Contains Lead; REACH SVHC: No SVHC; ComponentLink1URL: https://datasheet.ciiva.com/11821/0900766b80f806dd-11821385.pdf?src-supplier=RSComponents; ComponentLink1Description: https://datasheet.ciiva.com/11821/0900766b80f806dd-11821385.pdf?src-supplier=RSComponents; ComponentLink2URL: https://datasheet.ciiva.com/9119/aoa0000ce1-9119175.pdf?src-supplier=Avnet; ComponentLink2Description: https://datasheet.ciiva.com/9119/aoa0000ce1-9119175.pdf?src-supplier=Avnet; ComponentLink3URL: https://datasheet.ciiva.com/24071/aoa0000ce1-37422-24071816.pdf?src-supplier=Mouser; ComponentLink3Description: https://datasheet.ciiva.com/24071/aoa0000ce1-37422-24071816.pdf?src-supplier=Mouser; ComponentLink4URL: https://datasheet.ciiva.com/30072/4aoa0000ce1-30072265.pdf?src-supplier=Onlinecomponents.com; ComponentLink4Description: https://datasheet.ciiva.com/30072/4aoa0000ce1-30072265.pdf?src-supplier=Onlinecomponents.com; ComponentLink5URL: https://datasheet.ciiva.com/46379/1678796-46379916.pdf?src-supplier=Element14; ComponentLink5Description: https://datasheet.ciiva.com/46379/1678796-46379916.pdf?src-supplier=Element14; ComponentLink6URL: https://datasheet.ciiva.com/43470/1678796-43470111.pdf?src-supplier=Farnell; ComponentLink6Description: https://datasheet.ciiva.com/43470/1678796-43470111.pdf?src-supplier=Farnell
R665 R669 R670 = Resistor: Manufacturer 1: Yageo; Manufacturer Part Number 1: RC0402JR-070RL; Power Rating: 62.5mW; Tolerance: 5%; Voltage Rating: 50V; Max Power Dissipation: 63mW; Temperature Coefficient: 200ppm/°C; Supplier 1: Digi-Key; Supplier Part Number 1: 311-0.0JRCT-ND; Stock 1: 69822252; Pricing 1: 1=0.10000, 10=0.01200, 25=0.00920, 50=0.00680, 100=0.00510, 250=0.00388, 500=0.00308, 1000=0.00227, 5000=0.00163 (USD); RoHS: Yes; Case/Package: 0402; Contact Plating: Tin,Matte; Case Code (Metric): 1005; Case Code (Imperial): 0402; Min Operating Temperature: -55°C; Max Operating Temperature: 155°C; Resistance: 0mR; Packaging: Tape and Reel; Composition: Thick Film; Package Quantity: 1; Number of Terminations: 2; Termination: SMD/SMT; Military Standard: Not; Features: Moisture Resistant; Length: 1mm; Height: 0.016inch; Width: 0.02inch; Depth: 0.5mm; Radiation Hardening: No; REACH SVHC: Unknown; Lead Free: Lead Free; ComponentLink1URL: https://datasheet.ciiva.com/2452/pyu-rc0402-51-rohs-l-6-2452608.pdf?src-supplier=Digi-Key; ComponentLink1Description: https://datasheet.ciiva.com/2452/pyu-rc0402-51-rohs-l-6-2452608.pdf?src-supplier=Digi-Key; ComponentLink2URL: https://datasheet.ciiva.com/11808/0900766b80c66297-11808195.pdf?src-supplier=RSComponents; ComponentLink2Description: https://datasheet.ciiva.com/11808/0900766b80c66297-11808195.pdf?src-supplier=RSComponents; ComponentLink3URL: https://datasheet.ciiva.com/2452/pyu-r-int-thick-7-2452609.pdf?src-supplier=Digi-Key; ComponentLink3Description: https://datasheet.ciiva.com/2452/pyu-r-int-thick-7-2452609.pdf?src-supplier=Digi-Key; ComponentLink4URL: https://datasheet.ciiva.com/22747/1018594-22747515.pdf?src-supplier=Element14; ComponentLink4Description: https://datasheet.ciiva.com/22747/1018594-22747515.pdf?src-supplier=Element14; ComponentLink5URL: https://datasheet.ciiva.com/7983/1018594-7983535.pdf?src-supplier=Element14; ComponentLink5Description: https://datasheet.ciiva.com/7983/1018594-7983535.pdf?src-supplier=Element14; ComponentLink6URL: https://datasheet.ciiva.com/2452/pyu-r-int-thick-7-2452610.pdf?src-supplier=Digi-Key; ComponentLink6Description: https://datasheet.ciiva.com/2452/pyu-r-int-thick-7-2452610.pdf?src-supplier=Digi-Key; ComponentLink7URL: https://datasheet.ciiva.com/8896/pyu-rc0402-51-rohs-l-6-8896201.pdf?src-supplier=Avnet; ComponentLink7Description: https://datasheet.ciiva.com/8896/pyu-rc0402-51-rohs-l-6-8896201.pdf?src-supplier=Avnet; ComponentLink8URL: https://datasheet.ciiva.com/28386/pyu-rc0402-51-rohs-l-6-28386633.pdf?src-supplier=Avnet+Europe; ComponentLink8Description: https://datasheet.ciiva.com/28386/pyu-rc0402-51-rohs-l-6-28386633.pdf?src-supplier=Avnet+Europe; ComponentLink9URL: https://datasheet.ciiva.com/15189/getdatasheetpartid-326379-15189533.pdf?src-supplier=Verical; ComponentLink9Description: https://datasheet.ciiva.com/15189/getdatasheetpartid-326379-15189533.pdf?src-supplier=Verical
R666 = Resistor: RES 0.012 OHM 1% 1/2W 1206; Manufacturer: Stackpole Electronics; Manufacturer Part Number: CSR1206FK12L0; Temperature Coefficient: 100ppm/°C; Supplier 1: Digi-Key; Supplier Part Number 1: CSR1206FK12L0CT-ND; RoHS: Yes; Category: Chip SMD Resistors; Stock 1: 41108; Pricing 1: 1=0,65000, 10=0,46200, 25=0,36040, 50=0,30500, 100=0,24020, 250=0,20328, 500=0,16632 (USD); Mount: Surface Mount; Case Code (Metric): 3216; Case Code (Imperial): 1206; Contact Plating: Tin,Matte; Min Operating Temperature: -55°C; Max Operating Temperature: 155°C; Tolerance: 1%; Packaging: Tape and Reel; Resistance: 12mR; Composition: Thick Film; Number of Terminations: 2; Military Standard: Not; Length: 0.12inch; Height: 0.026inch; Width: 0.061inch; Depth: 1.55mm; Lead Free: Lead Free; ComponentLink1URL: https://www.seielect.com/catalog/SEI-Packaging.pdf?src-supplier=Digi-Key; ComponentLink1Description: https://www.seielect.com/catalog/SEI-Packaging.pdf?src-supplier=Digi-Key; ComponentLink2URL: http://components.arrow.com/part/dataview/53688935S790003N1174?src-supplier=Arrow; ComponentLink2Description: http://components.arrow.com/part/dataview/53688935S790003N1174?src-supplier=Arrow; ComponentLink3URL: https://www.seielect.com/Catalog/SEI-CSR_CSRN.pdf?src-supplier=Avnet; ComponentLink3Description: https://www.seielect.com/Catalog/SEI-CSR_CSRN.pdf?src-supplier=Avnet
R667 = Resistor: RES SMD 24.9KOHM 0.1% 1/16W 0402; Manufacturer: Panasonic; Manufacturer Part Number: ERA-2AEB2492X; Power Rating: 63mW; Voltage Rating: 25V; Temperature Coefficient: 25ppm/°C; Voltage Rating (DC): 50V; Supplier 1: Digi-Key; Supplier Part Number 1: P24.9KDCCT-ND; RoHS: Yes; Category: Chip SMD Resistors; Stock 1: 58145; Pricing 1: 1=0,45000, 10=0,32100, 100=0,12830, 1000=0,06322, 2500=0,05858, 5000=0,05300 (USD); Mount: Surface Mount; Case Code (Metric): 1005; Case Code (Imperial): 0402; Contact Plating: Tin; Min Operating Temperature: -55°C; Max Operating Temperature: 155°C; Resistance: 24.9kR; Packaging: Tape and Reel; Tolerance: 0.1%; Package Quantity: 1; Composition: Thin Film,Metal Film; Number of Terminations: 2; Military Standard: Not; Max Power Dissipation: 63mW; Features: Automotive AEC-Q200; Termination: Wraparound; Length: 1mm; Height: 0.016inch; Width: 0.02inch; Depth: 0.5mm; REACH SVHC: Unknown; Lead Free: Lead Free; ComponentLink1URL: http://www.farnell.com/datasheets/2052875.pdf?src-supplier=Farnell; ComponentLink1Description: http://www.farnell.com/datasheets/2052875.pdf?src-supplier=Farnell; ComponentLink2URL: http://components.arrow.com/part/dataview/0323_02931773?src-supplier=Arrow+Europe; ComponentLink2Description: http://components.arrow.com/part/dataview/0323_02931773?src-supplier=Arrow+Europe; ComponentLink3URL: http://www.mouser.com/ds/2/315/AOA0000C237-1100991.pdf?src-supplier=Mouser; ComponentLink3Description: http://www.mouser.com/ds/2/315/AOA0000C237-1100991.pdf?src-supplier=Mouser; ComponentLink4URL: http://industrial.panasonic.com/www-data/pdf/AOA0000/AOA0000CE26.pdf?src-supplier=Avnet+Asia; ComponentLink4Description: http://industrial.panasonic.com/www-data/pdf/AOA0000/AOA0000CE26.pdf?src-supplier=Avnet+Asia; ComponentLink5URL: http://www.onlinecomponents.com/datasheet/era-2aeb2492x.aspx?p=44473673&src-supplier=Onlinecomponents.com; ComponentLink5Description: http://www.onlinecomponents.com/datasheet/era-2aeb2492x.aspx?p=44473673&src-supplier=Onlinecomponents.com; ComponentLink6URL: https://industrial.panasonic.com/cdbs/www-data/pdf/RDM0000/AOA0000C307.pdf?src-supplier=Digi-Key; ComponentLink6Description: https://industrial.panasonic.com/cdbs/www-data/pdf/RDM0000/AOA0000C307.pdf?src-supplier=Digi-Key; ComponentLink7URL: http://www.farnell.com/datasheets/2052875.pdf?src-supplier=Newark; ComponentLink7Description: http://www.farnell.com/datasheets/2052875.pdf?src-supplier=Newark; ComponentLink8URL: http://www.farnell.com/datasheets/1818319.pdf?src-supplier=Element14; ComponentLink8Description: http://www.farnell.com/datasheets/1818319.pdf?src-supplier=Element14
R764 = WSHP28184L000FEA: RES 0.004 OHM 1% 10W 2818; Manufacturer: Vishay; Temperature Coefficient: 200ppm/°C; Supplier 1: Digi-Key; Manufacturer Part Number: WSHP28184L000FEA; Stock 1: 14; Pricing 1: 1 = 2,42000, 10 = 2,14700, 25 = 1,99080, 50 = 1,87380, 100 = 1,63960, 250 = 1,40540, 500 = 1,17118, 1000 = 1,01501 (USD); RoHS: No; Case/Package: Nonstandard; Min Operating Temperature: -65°C; Max Operating Temperature: 170°C; Composition: Metal Element; Features: Moisture Resistant,Automotive AEC-Q200; Packaging: Tape and Reel; Tolerance: 1%; Number of Terminations: 2; ComponentLink1URL: http://www.farnell.com/datasheets/2207403.pdf?src-supplier=Farnell; ComponentLink1Description: http://www.farnell.com/datasheets/2207403.pdf?src-supplier=Farnell; ComponentLink2URL: http://www.vishay.com/docs/30347/wshp2818.pdf?src-supplier=Digi-Key; ComponentLink2Description: http://www.vishay.com/docs/30347/wshp2818.pdf?src-supplier=Digi-Key; ComponentLink3URL: http://www.farnell.com/datasheets/2207403.pdf?src-supplier=Newark; ComponentLink3Description: http://www.farnell.com/datasheets/2207403.pdf?src-supplier=Newark
T34 = RJK0651DPB-00#J5: MOSFET N-CH 60V 25A LFPAK; Manufacturer: Renesas; Rise Time: 4.4ns; Turn-On Delay Time: 8.4ns; Turn-Off Delay Time: 42ns; Fall Time: 6.8ns; Gate to Source Voltage (Vgs): 20V; Rds On Max: 14mR; Input Capacitance: 2.03nF; Max Power Dissipation: 45W; Number of Elements: 1; Supplier 1: Mouser; Manufacturer Part Number: RJK0651DPB-00#J5; RoHS: Yes; Category: MOSFETs; Stock 1: 1853; Pricing 1: 1=1,29000, 10=1,15000, 25=1,11000, 100=0,90000, 250=0,85900, 500=0,73200 (USD); Mount: Surface Mount; Number of Pins: 5; Min Operating Temperature: -55°C; Max Operating Temperature: 150°C; Continuous Drain Current (ID): 25A; Package Quantity: 1; Packaging: Tape and Reel; Drain to Source Voltage (Vdss): 60V; Power Dissipation: 45W; Drain to Source Resistance: 14MR; Radiation Hardening: No; Lead Free: Lead Free; ComponentLink1URL: https://datasheet.ciiva.com/16481/r07ds0076ej0200-rjk0651dpb-16481749.pdf?src-supplier=Future+Electronics; ComponentLink1Description: https://datasheet.ciiva.com/16481/r07ds0076ej0200-rjk0651dpb-16481749.pdf?src-supplier=Future+Electronics
T35 = SIJ482DP-T1-GE3: MOSFET 80V 6.2mOhm@10V 60A N-Ch MV T-FET; Manufacturer: Vishay; Rds On Max: 6.2mR; Input Capacitance: 2.425nF; Gate to Source Voltage (Vgs): 20V; Power Dissipation: 69.4W; Turn-Off Delay Time: 72ns; Number of Elements: 1; Element Configuration: Single; On-State Resistance: 9.5MR; Turn-On Delay Time: 28ns; Threshold Voltage: 1.5V; Supplier 1: Digi-Key; Manufacturer Part Number: SIJ482DP-T1-GE3; RoHS: Yes; Category: MOSFETs; Stock 1: 1756; Pricing 1: 1=1,76000, 10=1,58300, 25=1,49360, 100=1,16490, 250=1,13508, 500=0,98572, 1000=0,83636 (USD); Mount: Through Hole,Surface Mount; Number of Pins: 5; Min Operating Temperature: -55°C; Max Operating Temperature: 150°C; Packaging: Tape and Reel; Package Quantity: 1; Drain to Source Resistance: 6.2mR; Drain to Source Breakdown Voltage: 80V; Continuous Drain Current (ID): 60A; Drain to Source Voltage (Vdss): 80V; Max Power Dissipation: 69.4W; Length: 5mm; Height: 1.14mm; Width: 4.47mm; Radiation Hardening: No; Lead Free: Lead Free; REACH SVHC: Unknown; ComponentLink1URL: https://datasheet.ciiva.com/30021/sij482dp-30021697.pdf?src-supplier=Avnet; ComponentLink1Description: https://datasheet.ciiva.com/30021/sij482dp-30021697.pdf?src-supplier=Avnet; ComponentLink2URL: https://datasheet.ciiva.com/4438/sij482dp-104025-4438550.pdf?src-supplier=Mouser; ComponentLink2Description: https://datasheet.ciiva.com/4438/sij482dp-104025-4438550.pdf?src-supplier=Mouser; ComponentLink3URL: https://datasheet.ciiva.com/16486/sij482dp-16486587.pdf?src-supplier=Future+Electronics; ComponentLink3Description: https://datasheet.ciiva.com/16486/sij482dp-16486587.pdf?src-supplier=Future+Electronics; ComponentLink4URL: https://datasheet.ciiva.com/6369/sij482dp-6369549.pdf?src-supplier=Digi-Key; ComponentLink4Description: https://datasheet.ciiva.com/6369/sij482dp-6369549.pdf?src-supplier=Digi-Key
U65 = MAX17557ATP+: IC REG CTRLR BUCK 20-TQFN; Manufacturer: Maxim; Supplier 1: Digi-Key; Manufacturer Part Number: MAX17557ATP+; Stock 1: 460; Pricing 1: 1 = 3,92000, 10 = 3,52200, 25 = 3,33000, 100 = 2,73800, 250 = 2,45680, 500 = 2,36800, 1000 = 2,22000 (USD); RoHS: No; ComponentLink1URL: https://datasheets.maximintegrated.com/en/ds/MAX17557.pdf?src-supplier=Digi-Key; ComponentLink1Description: https://datasheets.maximintegrated.com/en/ds/MAX17557.pdf?src-supplier=Digi-Key